# Altium project Salvatore Brake Kit v1.0.PrjPcb
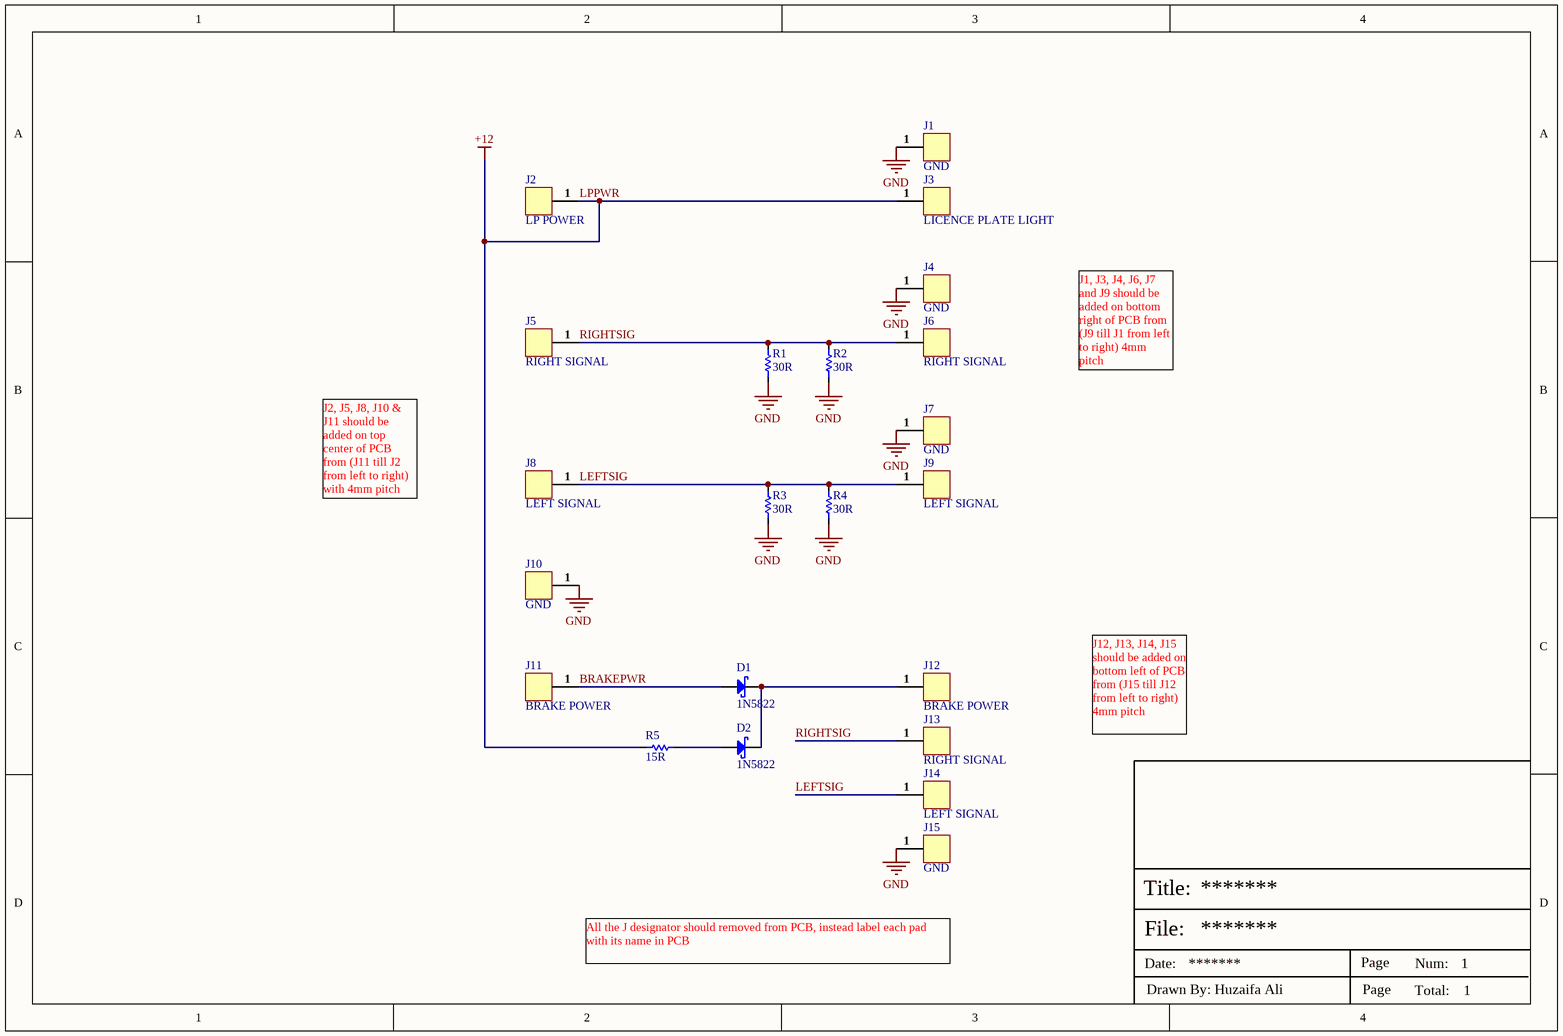
[diagram p0: Schematics Design v1.0.SchDoc]
1 sheet, 22 parts. Net scope: global (net labels, ports and power ports of the same name join across sheets).
Board file: Brake_kit_PCB.PcbDoc

## Sheet Schematics Design v1.0.SchDoc: Title
size A4; Date: *******; ApprovedBy: *******; CheckedBy: None; Author: *******; CompanyName: *******; DrawnBy: Name; Engineer: *******; Organization: *******; Address1: *******; Address2: *******; Address3: *******; Address4: *******; DocumentNumber: Doc Num; Revision: *******; SheetNumber: 1; SheetTotal: 1; CurrentTime: *******; CurrentDate: *******; Time: *******; DocumentFullPathAndName: *******; DocumentName: *******; ModifiedDate: *******; ImagePath: *******; ProjectName: *******; Application_BuildNumber: *******

### Parts
D1  1N5822  [DO-201AD]
D2  1N5822  [DO-201AD]
J1  GND  [Through Hole Pad (High Power)_]
J2  LP POWER  [Through Hole Pad (High Power)_]
J3  LICENCE PLATE LIGHT  [Through Hole Pad (High Power)_]
J4  GND  [Through Hole Pad (High Power)_]
J5  RIGHT SIGNAL  [Through Hole Pad (High Power)_]
J6  RIGHT SIGNAL  [Through Hole Pad (High Power)_]
J7  GND  [Through Hole Pad (High Power)_]
J8  LEFT SIGNAL  [Through Hole Pad (High Power)_]
J9  LEFT SIGNAL  [Through Hole Pad (High Power)_]
J10  GND  [Through Hole Pad (High Power)_]
J11  BRAKE POWER  [Through Hole Pad (High Power)_]
J12  BRAKE POWER  [Through Hole Pad (High Power)_]
J13  RIGHT SIGNAL  [Through Hole Pad (High Power)_]
J14  LEFT SIGNAL  [Through Hole Pad (High Power)_]
J15  GND  [Through Hole Pad (High Power)_]
R1  30R  [AC05000003009JAC00]
R2  30R  [AC05000003009JAC00]
R3  30R  [AC05000003009JAC00]
R4  30R  [AC05000003009JAC00]
R5  15R  [AC05000001509JAC00]

### Nets
GND: J1.1 J4.1 J7.1 J10.1 J15.1 R1.1 R2.1 R3.1 R4.1
LPPWR: J2.1 J3.1 R5.1  [also labelled +12]
BRAKEPWR: D1.2(A) J11.1
LEFTSIG: J8.1 J9.1 J14.1 R3.2 R4.2
RIGHTSIG: J5.1 J6.1 J13.1 R1.2 R2.2
NetD1_1: D1.1(K) D2.1(K) J12.1
NetD2_2: D2.2(A) R5.2

### Notes on the sheet
- J1, J3, J4, J6, J7 and J9 should be added on bottom right of PCB from (J9 till J1 from left to right) 4mm pitch
- J2, J5, J8, J10 & J11 should be added on top center of PCB from (J11 till J2 from left to right) with 4mm pitch
- J12, J13, J14, J15 should be added on bottom left of PCB from (J15 till J12 from left to right) 4mm pitch
- File:
- Title:
- All the J designator should removed from PCB, instead label each pad with its name in PCB
- Date:
- Page
- Num:
- Total:
- Drawn By: Huzaifa Ali

### Library data of the parts
D1 D2 = 1N5822: 40V 3A 525mV@3A DO-201AD Schottky Barrier Diodes (SBD) ROHS; Manufacturer: FUXINSEMI; Item Type: Diode; Manufacturer Part Number: 1N5822; Package: DO-201AD; LCSC Part Number: C3018526; ComponentLink1Description: LCSC; ComponentLink1URL: https://www.lcsc.com/product-detail/Schottky-Barrier-Diodes-SBD_FUXINSEMI-1N5822_C3018526.html
J1-J15 = Through_Hole_Pad: Wire Connecting Pad
R1-R4 = AC05000003009JAC00: RES 30 OHM 5W 5% AXIAL; Manufacturer: Vishay; Item Type: Resistor; Supplier: Mouser; Supplier Part Number: 594-AC05W30R00J; Manufacturer Part Number: AC05000003009JAC00; RoHS: Yes; Category: Through-Hole Resistors; Stock: 1347; Pricing: 1=0.9, 10=0.647, 50=0.647, 100=0.489, 1000=0.326, 10000=0.305 (USD); ComponentLink1URL: https://datasheet.ciiva.com/2714/acseries-2714814.pdf?src-supplier=Digi-Key; ComponentLink1Description: https://datasheet.ciiva.com/2714/acseries-2714814.pdf?src-supplier=Digi-Key; ComponentLink2URL: https://datasheet.ciiva.com/2714/acseries-2714815.pdf?src-supplier=Digi-Key; ComponentLink2Description: https://datasheet.ciiva.com/2714/acseries-2714815.pdf?src-supplier=Digi-Key; ComponentLink3URL: https://datasheet.ciiva.com/8329/acseries-8329545.pdf?src-supplier=Avnet; ComponentLink3Description: https://datasheet.ciiva.com/8329/acseries-8329545.pdf?src-supplier=Avnet; ComponentLink4URL: https://datasheet.ciiva.com/7175/1819490-7175151.pdf?src-supplier=Newark; ComponentLink4Description: https://datasheet.ciiva.com/7175/1819490-7175151.pdf?src-supplier=Newark; LCSC Part Number: C1364699
R5 = AC05000001509JAC00: RES 15 OHM 5W 5% AXIAL; Manufacturer: Vishay; Item Type: Resistor; Supplier: Mouser; Supplier Part Number: 594-AC05W15R00J; Manufacturer Part Number: AC05000001509JAC00; RoHS: Yes; Category: Through-Hole Resistors; Stock: 3720; Pricing: 1=0.86, 10=0.647, 50=0.647, 100=0.489, 1000=0.327, 10000=0.305 (USD); ComponentLink1URL: https://datasheet.ciiva.com/2714/acseries-2714740.pdf?src-supplier=Digi-Key; ComponentLink1Description: https://datasheet.ciiva.com/2714/acseries-2714740.pdf?src-supplier=Digi-Key; ComponentLink2URL: https://datasheet.ciiva.com/2714/acseries-2714741.pdf?src-supplier=Digi-Key; ComponentLink2Description: https://datasheet.ciiva.com/2714/acseries-2714741.pdf?src-supplier=Digi-Key; ComponentLink3URL: https://datasheet.ciiva.com/7301/1819490-7301941.pdf?src-supplier=Newark; ComponentLink3Description: https://datasheet.ciiva.com/7301/1819490-7301941.pdf?src-supplier=Newark; ComponentLink4URL: https://datasheet.ciiva.com/1479/acseries-1479826.pdf?src-supplier=Element14; ComponentLink4Description: https://datasheet.ciiva.com/1479/acseries-1479826.pdf?src-supplier=Element14; ComponentLink5URL: https://datasheet.ciiva.com/8321/acseries-8321756.pdf?src-supplier=Avnet; ComponentLink5Description: https://datasheet.ciiva.com/8321/acseries-8321756.pdf?src-supplier=Avnet; LCSC Part Number: C1364893